# EasyEDA Pro project IncubaSense.epro

# Schematic IncubaSense_SCH
Board Name: Board1; Create Date: 2025-12-17; Page Name: P1; Project Name: IncubaSense; Schematic Name: IncubaSense_SCH; Update Date: 2025-12-18; Company: EasyEDA.com; Page Size: A4; Version: V1.0
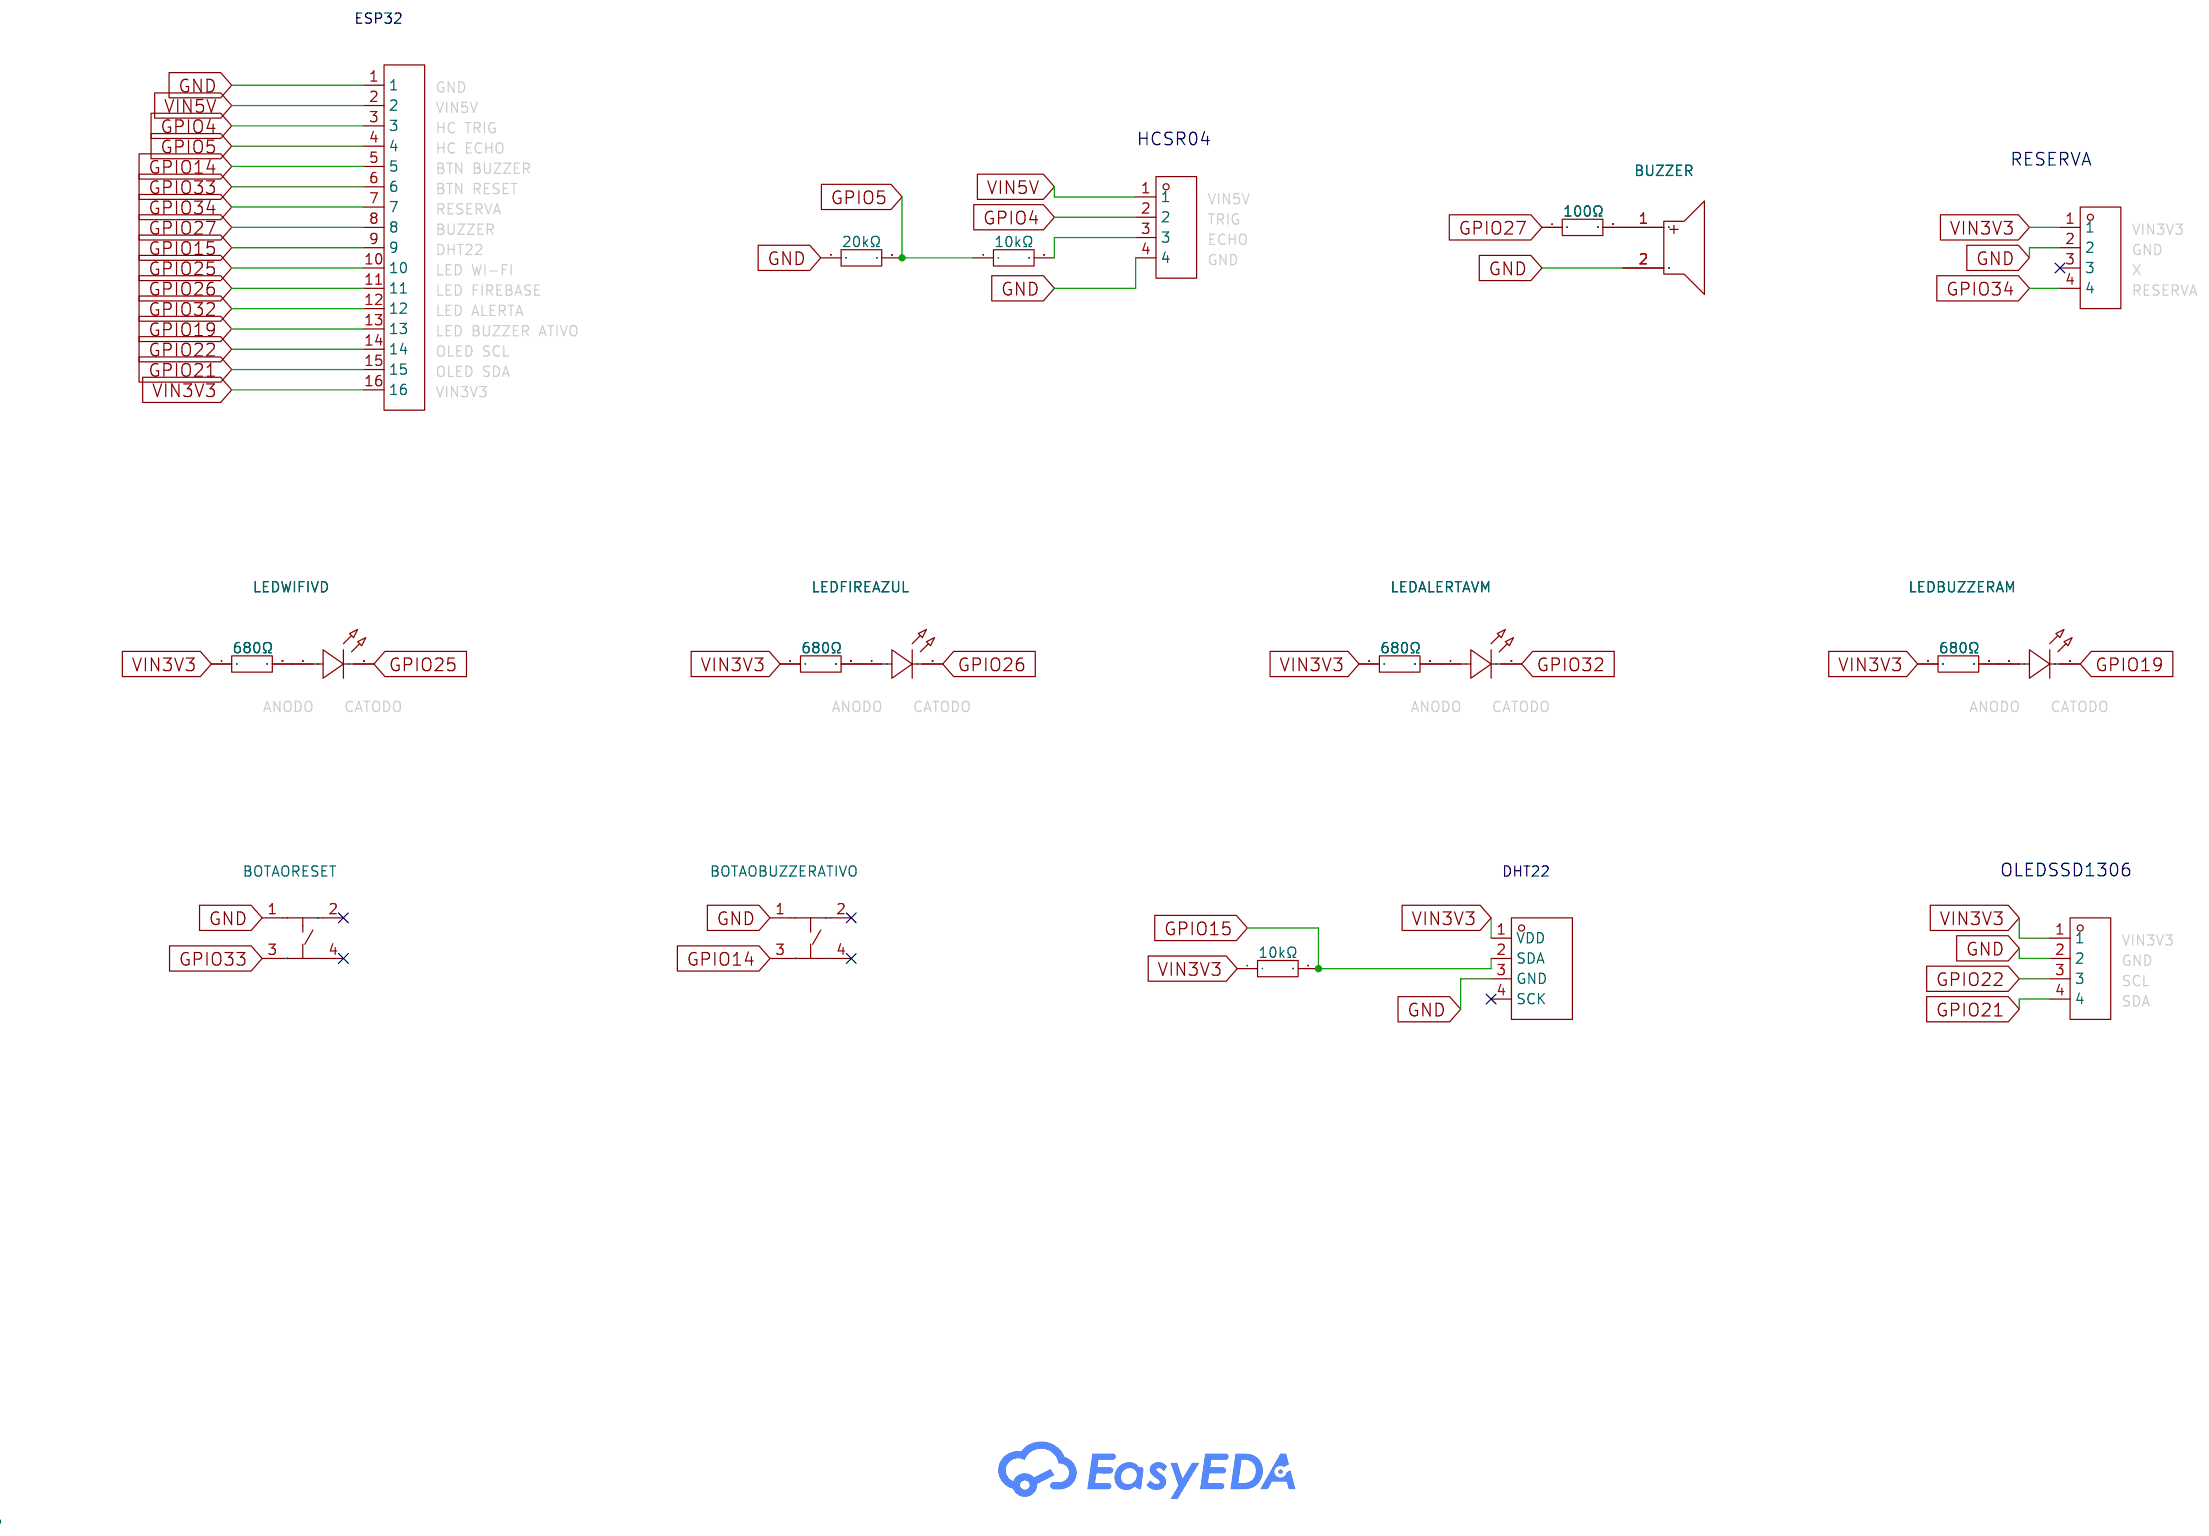
[diagram p0: schematic sheet]

## Parts
BOTAOBUZZERATIVO  4pinTACTPCBTHTPushButton  [SW-SMD_4P-L6.0-W6.0-P4.50-LS10.0_TL3301EF160QG]
BOTAORESET  4pinTACTPCBTHTPushButton  [SW-SMD_4P-L6.0-W6.0-P4.50-LS10.0_TL3301EF160QG]
BUZZER  4.1kHz  [BUZ-TH_BD14.0-P7.60-D0.7-FD]
DHT22  DHT22  [SENSOR-TH_HAIGU_DHT22]
ESP32  PZ2.54-1*16  [HDR-TH_16P-P2.54-V-M]
HCSR04  -  [HDR-TH_4P-P2.54-V-F]
LEDALERTAVM  5mm_LED  [LED-TH_BD5.0-P2.54-FD]
LEDBUZZERAM  5mm_LED  [LED-TH_BD5.0-P2.54-FD]
LEDFIREAZUL  5mm_LED  [LED-TH_BD5.0-P2.54-FD]
LEDWIFIVD  5mm_LED  [LED-TH_BD5.0-P2.54-FD]
OLEDSSD1306  -  [HDR-TH_4P-P2.54-V-F]
RBUZZER  100Ω  [RES-TH_BD1.8-L3.2-P7.20-D0.4]
RDHT  10kΩ  [RES-TH_BD1.8-L3.2-P7.20-D0.4]
RESERVA  -  [HDR-TH_4P-P2.54-V-F]
RHC10  10kΩ  [RES-TH_BD1.8-L3.2-P7.20-D0.4]
RHC20  20kΩ  [RES-TH_BD1.8-L3.2-P7.20-D0.4]
RLEDALERTAVERM  680Ω  [RES-TH_BD1.8-L3.2-P7.20-D0.4]
RLEDBUZZERAMA  680Ω  [RES-TH_BD1.8-L3.2-P7.20-D0.4]
RLEDFIREAZUL  680Ω  [RES-TH_BD1.8-L3.2-P7.20-D0.4]
RLEDWIFI  680Ω  [RES-TH_BD1.8-L3.2-P7.20-D0.4]

## Library data of the parts
BOTAOBUZZERATIVO BOTAORESET = 4pinTACTPCBTHTPushButton: Supplier Part: C9900003768; Supplier Footprint: 1301.9316; JLCPCB Part Class: Extended Part; Supplier: LCSC
BUZZER = CEP-2242: Driver Circuitry:Active Buzzer (Built-in Driving Circuit) Voltage Rating:12V Voltage - Supply:4V~16V Voltage - Supply:4V~16V Frequency:4.1kHz Current Consumption:15mA Sound Pressure Level(SPL):77dB Diameter(φD):13.9mm Height:7.5mm Operating Temperature:-2; Supplier Part: C22359741; Manufacturer: CUI; JLCPCB Part Class: Extended Part; Datasheet: https://item.szlcsc.com/datasheet/CEP-2242/23802214.html; Supplier: LCSC; Driver Circuitry: Active Buzzer (Built-in Driving Circuit); Voltage Rating: 12V; Voltage - Supply: 4V~16V; Current Consumption: 15mA; Sound Pressure Level(SPL): 77dB; Diameter(φD): 13.9mm; Height: 7.5mm; Operating Temperature: -20℃~+70℃
DHT22 = DHT22: Temperature:-40℃~+80℃ Temperature:-40℃~+80℃ Humidity:5%RH~99%RH Humidity:5%RH~99%RH Supply Voltage:3.3V Supply Voltage:3.3V Supply Current:500uA Resolution:±3%RH Resolution:±3%RH; LCSC Part Name: 数字温湿度模块12mm*15.5mm*5.9mm; Supplier Part: C2880291; Manufacturer: HAIGU(广州海谷); Supplier Footprint: 插件; JLCPCB Part Class: Extended Part; Datasheet: https://atta.szlcsc.com/upload/public/pdf/source/20230523/7507864DBB8AF99FF82B5DD1568971DB.pdf; Supplier: LCSC; Temperature: -40℃~+80℃; Humidity: 5%RH~99%RH; Supply Voltage: 3.3V; Supply Current: 500uA; Resolution: ±3%RH
ESP32 = PZ2.54-1*16: Pin Structure:1x16P Pitch:2.54mm Circluar Pins/Square Pins:Pin Header Mounting Type:Through Hole Number of Rows:1 Number of Pins:16P Current Rating:2.5A Length of Mating Pin:6mm Insulation Height:2.54mm Length of End Connection Pin:3mm Contact Material:Br; LCSC Part Name: 1x16P 间距:2.54mm 方针 直插; Supplier Part: C5360903; Manufacturer: ZHOURI(洲日); Supplier Footprint: 插件,P=2.54mm; JLCPCB Part Class: Extended Part; Datasheet: https://item.szlcsc.com/datasheet/PZ2.54-1*16/6180462.html; Supplier: LCSC; Pin Structure: 1x16P; Pitch: 2.54mm; Circluar Pins/Square Pins: Pin Header; Mounting Type: Through Hole; Number of Rows: 1; Number of Pins: 16P; Current Rating: 2.5A; Length of Mating Pin: 6mm; Insulation Height: 2.54mm; Length of End Connection Pin: 3mm; Contact Material: Brass; Contact Plating: Gold; Operating Temperature: -40℃~+105℃
HCSR04 OLEDSSD1306 RESERVA = HDR-F_2.54_1x4P: Supplier Footprint: Through
LEDALERTAVM LEDBUZZERAM LEDFIREAZUL LEDWIFIVD = 5mm_LED: Supplier Part: C9900148483; Supplier Footprint: DIP; Supplier: LCSC
RBUZZER RDHT RHC10 RHC20 RLEDALERTAVERM RLEDBUZZERAMA RLEDFIREAZUL RLEDWIFI = Res_AXIAL-1/8W: Supplier Footprint: Through

## Nets
GND: BOTAOBUZZERATIVO.1 BOTAORESET.1 BUZZER.2 DHT22.3(GND) ESP32.1 HCSR04.4 OLEDSSD1306.2 RESERVA.2 RHC20.1
VIN3V3: DHT22.1(VDD) ESP32.16 OLEDSSD1306.1 RDHT.1 RESERVA.1 RLEDALERTAVERM.1 RLEDBUZZERAMA.1 RLEDFIREAZUL.1 RLEDWIFI.1
VIN5V: ESP32.2 HCSR04.1
GPIO4: ESP32.3 HCSR04.2
GPIO5: ESP32.4 RHC10.1 RHC20.2
GPIO14: BOTAOBUZZERATIVO.3 ESP32.5
GPIO15: DHT22.2(SDA) ESP32.9 RDHT.2
GPIO19: ESP32.13 LEDBUZZERAM.2(K)
GPIO21: ESP32.15 OLEDSSD1306.4
GPIO22: ESP32.14 OLEDSSD1306.3
GPIO25: ESP32.10 LEDWIFIVD.2(K)
GPIO26: ESP32.11 LEDFIREAZUL.2(K)
GPIO27: ESP32.8 RBUZZER.1
GPIO32: ESP32.12 LEDALERTAVM.2(K)
GPIO33: BOTAORESET.3 ESP32.6
GPIO34: ESP32.7 RESERVA.4
$1N884: HCSR04.3 RHC10.2
$1N2088: LEDFIREAZUL.1(A) RLEDFIREAZUL.2
$1N2189: LEDWIFIVD.1(A) RLEDWIFI.2
$1N2270: LEDALERTAVM.1(A) RLEDALERTAVERM.2
$1N2351: LEDBUZZERAM.1(A) RLEDBUZZERAMA.2
$1N2650: BUZZER.1 RBUZZER.2

Not connected (* = marked no-connect by the designer): BOTAOBUZZERATIVO 2* 4*; BOTAORESET 2* 4*; DHT22 4(SCK)*; RESERVA 3*

## Notes on the sheet
- GND
- VIN5V
- HC TRIG
- HC ECHO
- BTN BUZZER
- BTN RESET
- RESERVA
- VIN5V
- BUZZER
- TRIG
- VIN3V3
- DHT22
- ECHO
- GND
- GND
- LED WI-FI
- X
- LED FIREBASE
- RESERVA
- LED ALERTA
- LED BUZZER ATIVO
- OLED SCL
- OLED SDA
- VIN3V3
- ANODO
- CATODO
- ANODO
- CATODO
- ANODO
- CATODO
- ANODO
- CATODO
- VIN3V3
- GND
- SCL
- SDA

# Board IncubaSense_PCB
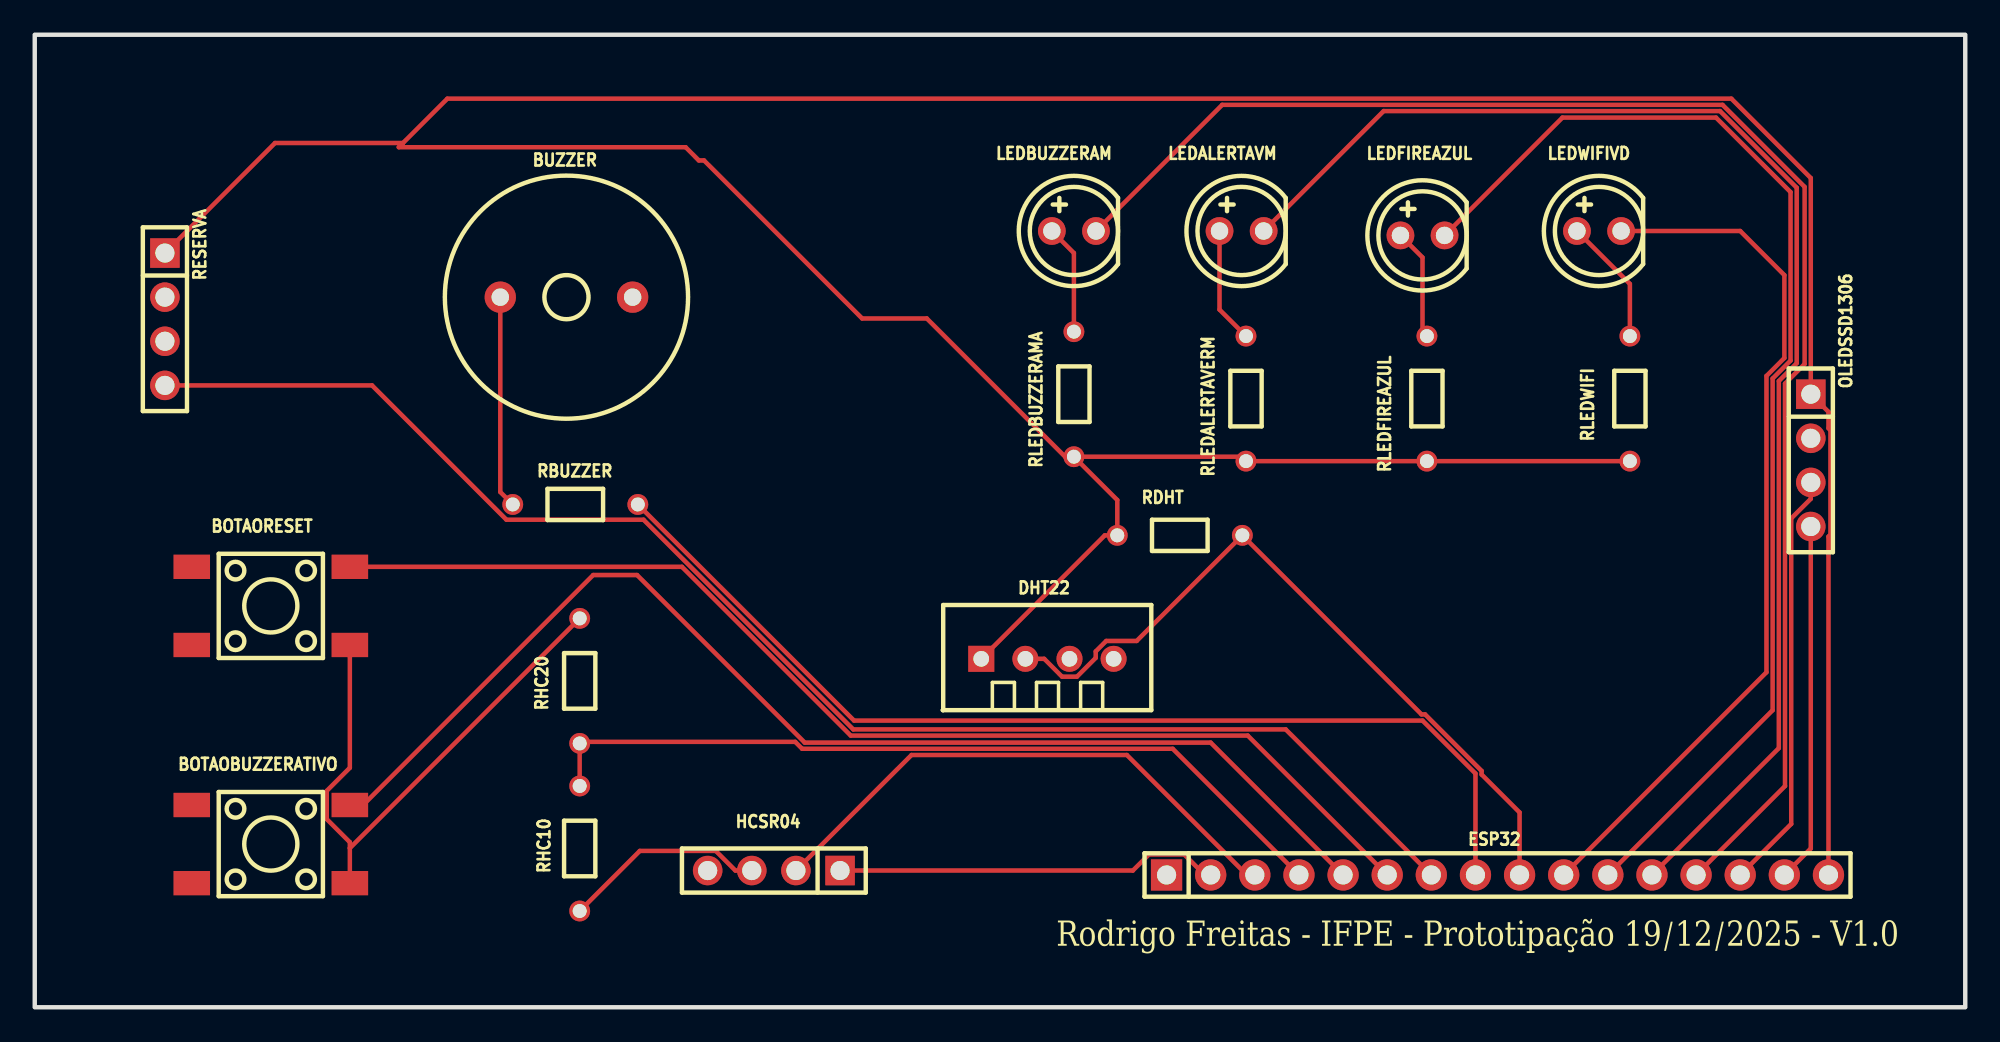
[diagram p1: board, top side]
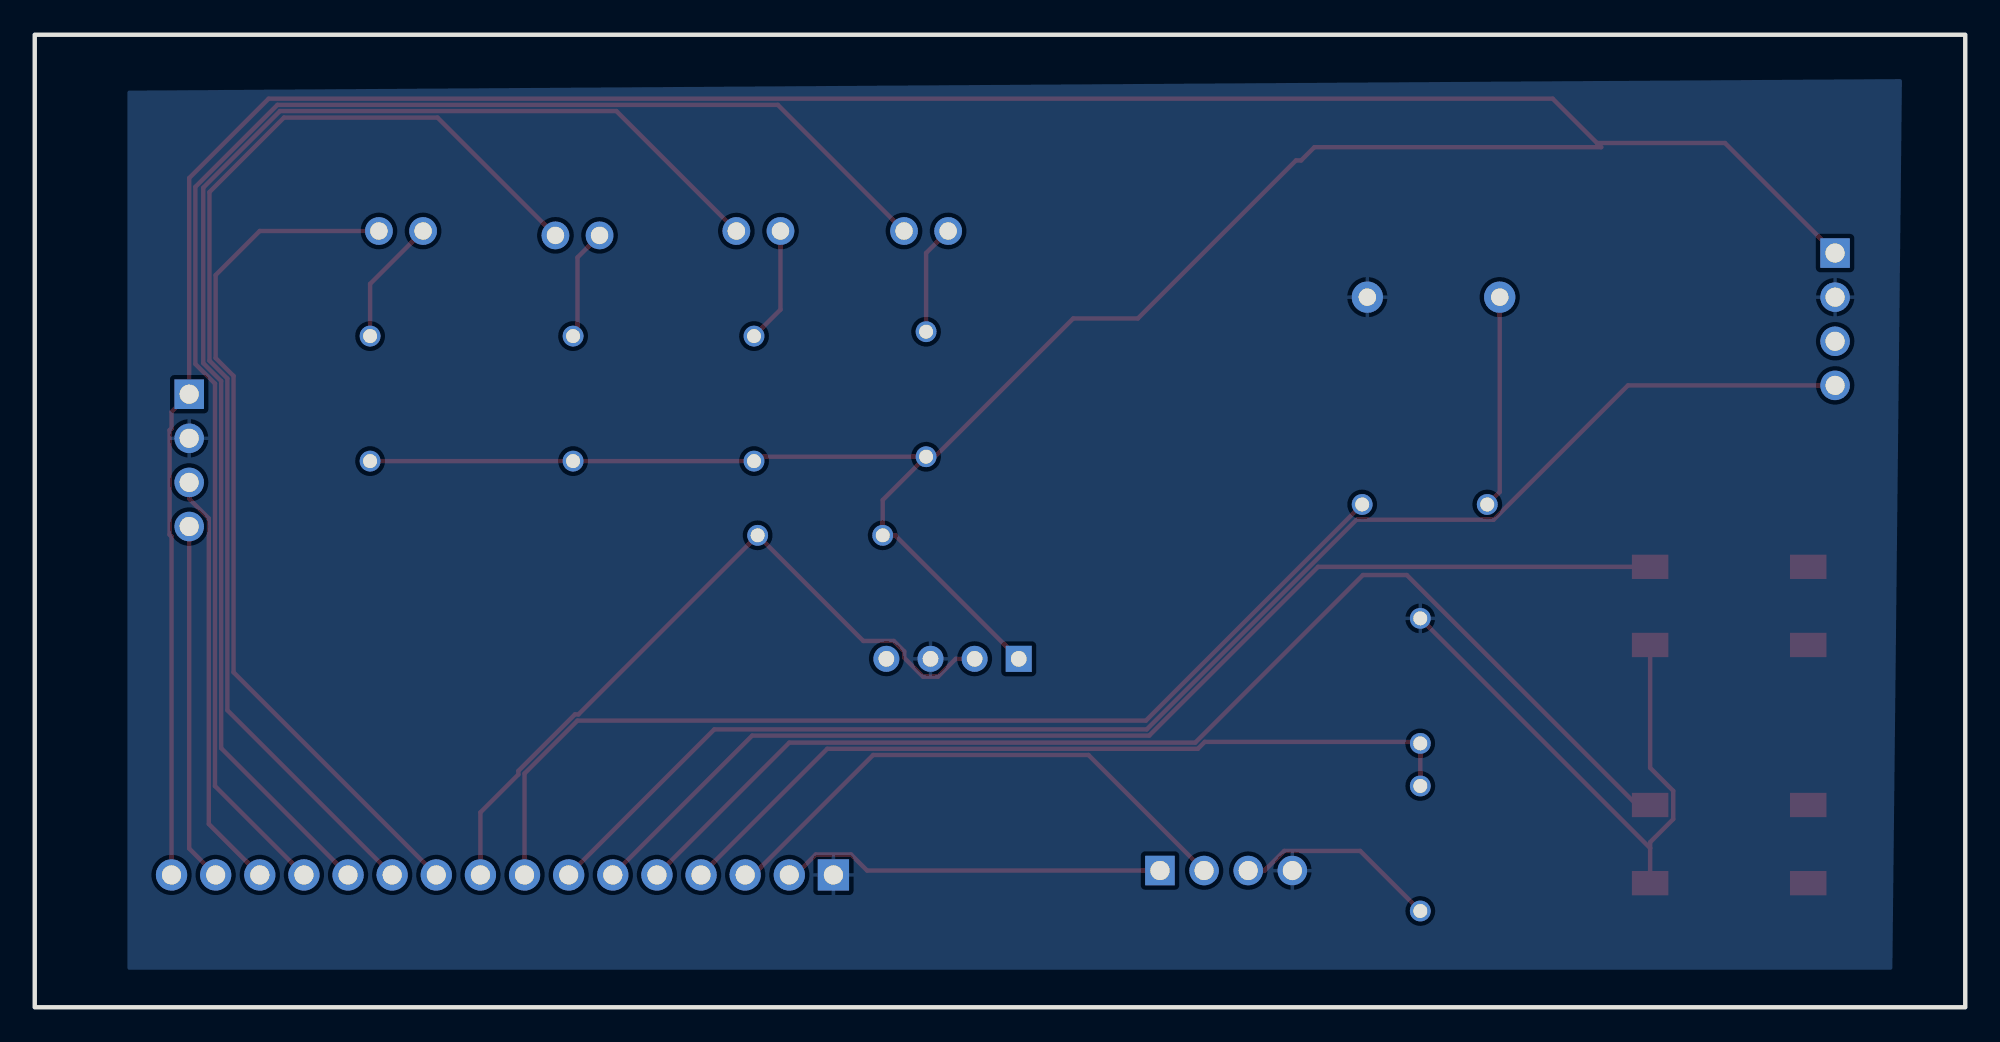
[diagram p2: board, bottom side, seen from below]

Outline 111.12 x 56.01 mm; copper layers: Top Layer, Bottom Layer. Coordinates in mm from the lower left corner of the outline.
Outline path: rectangle 0,56.01 111.12,0
Stack: Top Layer 0.035mm / Dielectric1 1.51mm FR4 er 4.5 / Bottom Layer 0.035mm

## Design rules (mm)
template: JLCPCB Capability(Two Layers Board)
spacing copperThickness1oz (default): track to track 0.102, other pairs 0.152 to 0.3
spacing copperThickness2oz: track to track 0.203, other pairs 0.152 to 0.3
track width copperThickness1oz (default): min 0.127, default 0.254, max 2.54
track width copperThickness2oz: min 0.203, default 0.254, max 2.54
differential pair differentialPair (default): width min 0.127, default 0.254, max 2.54; gap min 0.152, default 0.152
via viaSize (default): diameter min 0.5, default 0.61, max 10; hole min 0.3, default 0.305, max 6.3

## Placement (name value [footprint] x y rotation side)
BOTAOBUZZERATIVO  4pinTACTPCBTHTPushButton  [SW-SMD_4P-L6.0-W6.0-P4.50-LS10.0_TL3301EF160QG]  13.59 9.4 180 top
BOTAORESET  4pinTACTPCBTHTPushButton  [SW-SMD_4P-L6.0-W6.0-P4.50-LS10.0_TL3301EF160QG]  13.59 23.11 180 top
BUZZER  4.1kHz  [BUZ-TH_BD14.0-P7.60-D0.7-FD]  30.61 40.89 0 top
DHT22  DHT22  [SENSOR-TH_HAIGU_DHT22]  58.29 20.07 0 top
ESP32  PZ2.54-1*16  [HDR-TH_16P-P2.54-V-M]  84.2 7.62 0 top
HCSR04  -  [HDR-TH_4P-P2.54-V-F]  42.55 7.87 180 top
LEDALERTAVM  5mm_LED  [LED-TH_BD5.0-P2.54-FD]  69.47 44.7 0 top
LEDBUZZERAM  5mm_LED  [LED-TH_BD5.0-P2.54-FD]  59.82 44.7 0 top
LEDFIREAZUL  5mm_LED  [LED-TH_BD5.0-P2.54-FD]  79.88 44.45 0 top
LEDWIFIVD  5mm_LED  [LED-TH_BD5.0-P2.54-FD]  90.04 44.7 0 top
OLEDSSD1306  -  [HDR-TH_4P-P2.54-V-F]  102.24 31.5 270 top
RBUZZER  100Ω  [RES-TH_BD1.8-L3.2-P7.20-D0.4]  31.12 28.96 180 top
RDHT  10kΩ  [RES-TH_BD1.8-L3.2-P7.20-D0.4]  65.91 27.18 0 top
RESERVA  -  [HDR-TH_4P-P2.54-V-F]  7.49 39.62 270 top
RHC10  10kΩ  [RES-TH_BD1.8-L3.2-P7.20-D0.4]  31.37 9.14 270 top
RHC20  20kΩ  [RES-TH_BD1.8-L3.2-P7.20-D0.4]  31.37 18.8 270 top
RLEDALERTAVERM  680Ω  [RES-TH_BD1.8-L3.2-P7.20-D0.4]  69.72 35.05 90 top
RLEDBUZZERAMA  680Ω  [RES-TH_BD1.8-L3.2-P7.20-D0.4]  59.82 35.31 90 top
RLEDFIREAZUL  680Ω  [RES-TH_BD1.8-L3.2-P7.20-D0.4]  80.14 35.05 90 top
RLEDWIFI  680Ω  [RES-TH_BD1.8-L3.2-P7.20-D0.4]  91.82 35.05 90 top

## Footprints (pads in the part's own frame, mm; a bottom-side part is the same pattern mirrored in y, then rotated)
BUZ-TH_BD14.0-P7.60-D0.7-FD
  round 1.8 hole 1: 1(-3.81,0) 2(3.81,0)
HDR-TH_4P-P2.54-V-F
  rect 1.7x1.7 hole 1.1: 1(-3.81,0)
  round 1.7 hole 1.1: 2(-1.27,0) 3(1.27,0) 4(3.81,0)
HDR-TH_16P-P2.54-V-M
  rect 1.8x1.8 hole 1.1: 1(-19.05,0)
  round 1.8 hole 1.1: 2(-16.51,0) 3(-13.97,0) 4(-11.43,0) 5(-8.89,0) 6(-6.35,0) 7(-3.81,0) 8(-1.27,0) 9(1.27,0) 10(3.81,0) 11(6.35,0) 12(8.89,0) 13(11.43,0) 14(13.97,0) 15(16.51,0) 16(19.05,0)
LED-TH_BD5.0-P2.54-FD
  round 1.6 hole 1: 1(-1.27,0) 2(1.27,0)
RES-TH_BD1.8-L3.2-P7.20-D0.4
  round 1.2 hole 0.8: 1(-3.6,0) 2(3.6,0)
SENSOR-TH_HAIGU_DHT22
  rect 1.5x1.5 hole 0.9: 1(-3.81,0)
  round 1.5 hole 0.9: 2(-1.27,0) 3(1.27,0) 4(3.81,0)
SW-SMD_4P-L6.0-W6.0-P4.50-LS10.0_TL3301EF160QG
  rect 2.1x1.4 smd: 1(-4.55,2.25) 2(4.55,2.25) 3(-4.55,-2.25) 4(4.55,-2.25)

## Nets
As in the schematic.

Pads without a net: BOTAOBUZZERATIVO 2 4; BOTAORESET 2 4; DHT22 4; RESERVA 3

## Routing (per net, layer and track width the routed paths; a pad name or vN(x,y) marks a point on that pad's centre or on a via; arc(x,y) is an arc through that point)
GND: length 33.5
  Top Layer w0.254: 18.14,9.17 18.14,9.5 16.81,10.83 16.81,12.46 18.14,13.79 BOTAORESET.1 ; 18.14,9.17 RHC20.1 ; 18.14,9.17 BOTAOBUZZERATIVO.1
VIN3V3: length 236
  Top Layer w0.254: DHT22.1 61.59,27.18 RDHT.1 62.31,29.21 RLEDBUZZERAMA.1 ; RLEDBUZZERAMA.1 69.47,31.71 RLEDALERTAVERM.1 RLEDFIREAZUL.1 RLEDWIFI.1 ; RLEDBUZZERAMA.1 59.31,31.71 51.35,39.67 47.62,39.67 38.53,48.77 38.23,48.77 37.47,49.53 20.96,49.53 21.2,49.77 ; ESP32.16 103.25,27.11 103.36,27.22 103.36,33.23 103.25,33.35 103.25,34.29 OLEDSSD1306.1 102.24,47.75 97.66,52.32 23.75,52.32 21.2,49.77 ; RESERVA.1 13.83,49.77 21.2,49.77
VIN5V: length 22.2
  Top Layer w0.254: HCSR04.1 63.21,7.87 64.14,8.8 66.17,8.8 67.09,7.87 67.44,7.87 ESP32.2
GPIO4: length 32
  Top Layer w0.254: ESP32.3 69.77,7.62 62.87,14.53 50.47,14.53 HCSR04.2
GPIO5: length 47
  Top Layer w0.254: ESP32.4 65.51,14.88 44.18,14.88 43.78,15.28 31.37,15.28 ; RHC20.2 RHC10.1
GPIO14: length 69.1
  Top Layer w0.254: 18.9,11.65 32.15,24.89 34.67,24.89 44.32,15.24 67.69,15.24 ESP32.5
GPIO15: length 42.8
  Top Layer w0.254: ESP32.9 85.47,11.22 83.29,13.4 83.29,13.61 80.03,16.87 79.83,16.87 RDHT.2 63.43,21.09 61.68,21.09 61.07,20.49 61.07,20.12 59.99,19.04 59.14,19.04 58.11,20.07 DHT22.2
GPIO19: length 88
  Top Layer w0.254: LEDBUZZERAM.2 68.35,51.97 97.16,51.97 101.88,47.24 101.88,37.04 100.75,35.92 100.75,12.74 ESP32.13
GPIO21: length 20.7
  Top Layer w0.254: ESP32.15 102.24,9.14 OLEDSSD1306.4
GPIO22: length 24.3
  Top Layer w0.254: OLEDSSD1306.3 102.24,29.28 101.11,28.15 101.11,10.55 ESP32.14
GPIO25: length 50.3
  Top Layer w0.254: ESP32.10 99.68,19.29 99.68,36.36 100.71,37.39 100.71,42.16 98.17,44.7 LEDWIFIVD.2
GPIO26: length 68.2
  Top Layer w0.254: LEDFIREAZUL.2 87.94,51.24 96.78,51.24 101.07,46.94 101.07,37.24 100.04,36.21 100.04,17.11 ESP32.11
GPIO27: length 60.5
  Top Layer w0.254: RBUZZER.1 47.16,16.51 79.88,16.51 82.93,13.46 ESP32.8
GPIO32: length 78.4
  Top Layer w0.254: ESP32.12 100.39,14.92 100.39,36.06 101.42,37.09 101.42,47.2 97.01,51.61 77.65,51.61 LEDALERTAVM.2
GPIO33: length 67.1
  Top Layer w0.254: BOTAORESET.3 37.25,25.36 46.97,15.65 69.83,15.65 ESP32.6
GPIO34: length 84.6
  Top Layer w0.254: RESERVA.4 19.41,35.81 27.15,28.08 35.04,28.08 47.12,16 72.01,16 ESP32.7
$1N884: length 11.8
  Top Layer w0.254: HCSR04.3 40.33,7.87 39.2,9 34.83,9 RHC10.2
$1N2088: length 5.9
  Top Layer w0.254: LEDFIREAZUL.1 79.88,43.18 79.88,39.12
$1N2189: length 7.3
  Top Layer w0.254: RLEDWIFI.2 91.82,41.66 LEDWIFIVD.1
$1N2270: length 6.7
  Top Layer w0.254: LEDALERTAVM.1 68.2,40.18 RLEDALERTAVERM.2
$1N2351: length 6.3
  Top Layer w0.254: RLEDBUZZERAMA.2 59.82,43.43 LEDBUZZERAM.1
$1N2650: length 12.2
  Top Layer w0.254: RBUZZER.2 26.8,29.67 BUZZER.1

## Copper pours and planes (outline as drawn; the poured copper is in the pictures)
GND on Bottom Layer: 105.79,52.79 3.65,53.45 4.2,2.16 105.79,2.16

## Text on the board
Top Silkscreen Layer: Rodrigo Freitas - IFPE - Prototipação 19/12/2025 - V1.0
